# EasyEDA Pro project cyclex.epro

# Schematic Schematic1
Board Name: Board1; Create Date: 2025-05-11
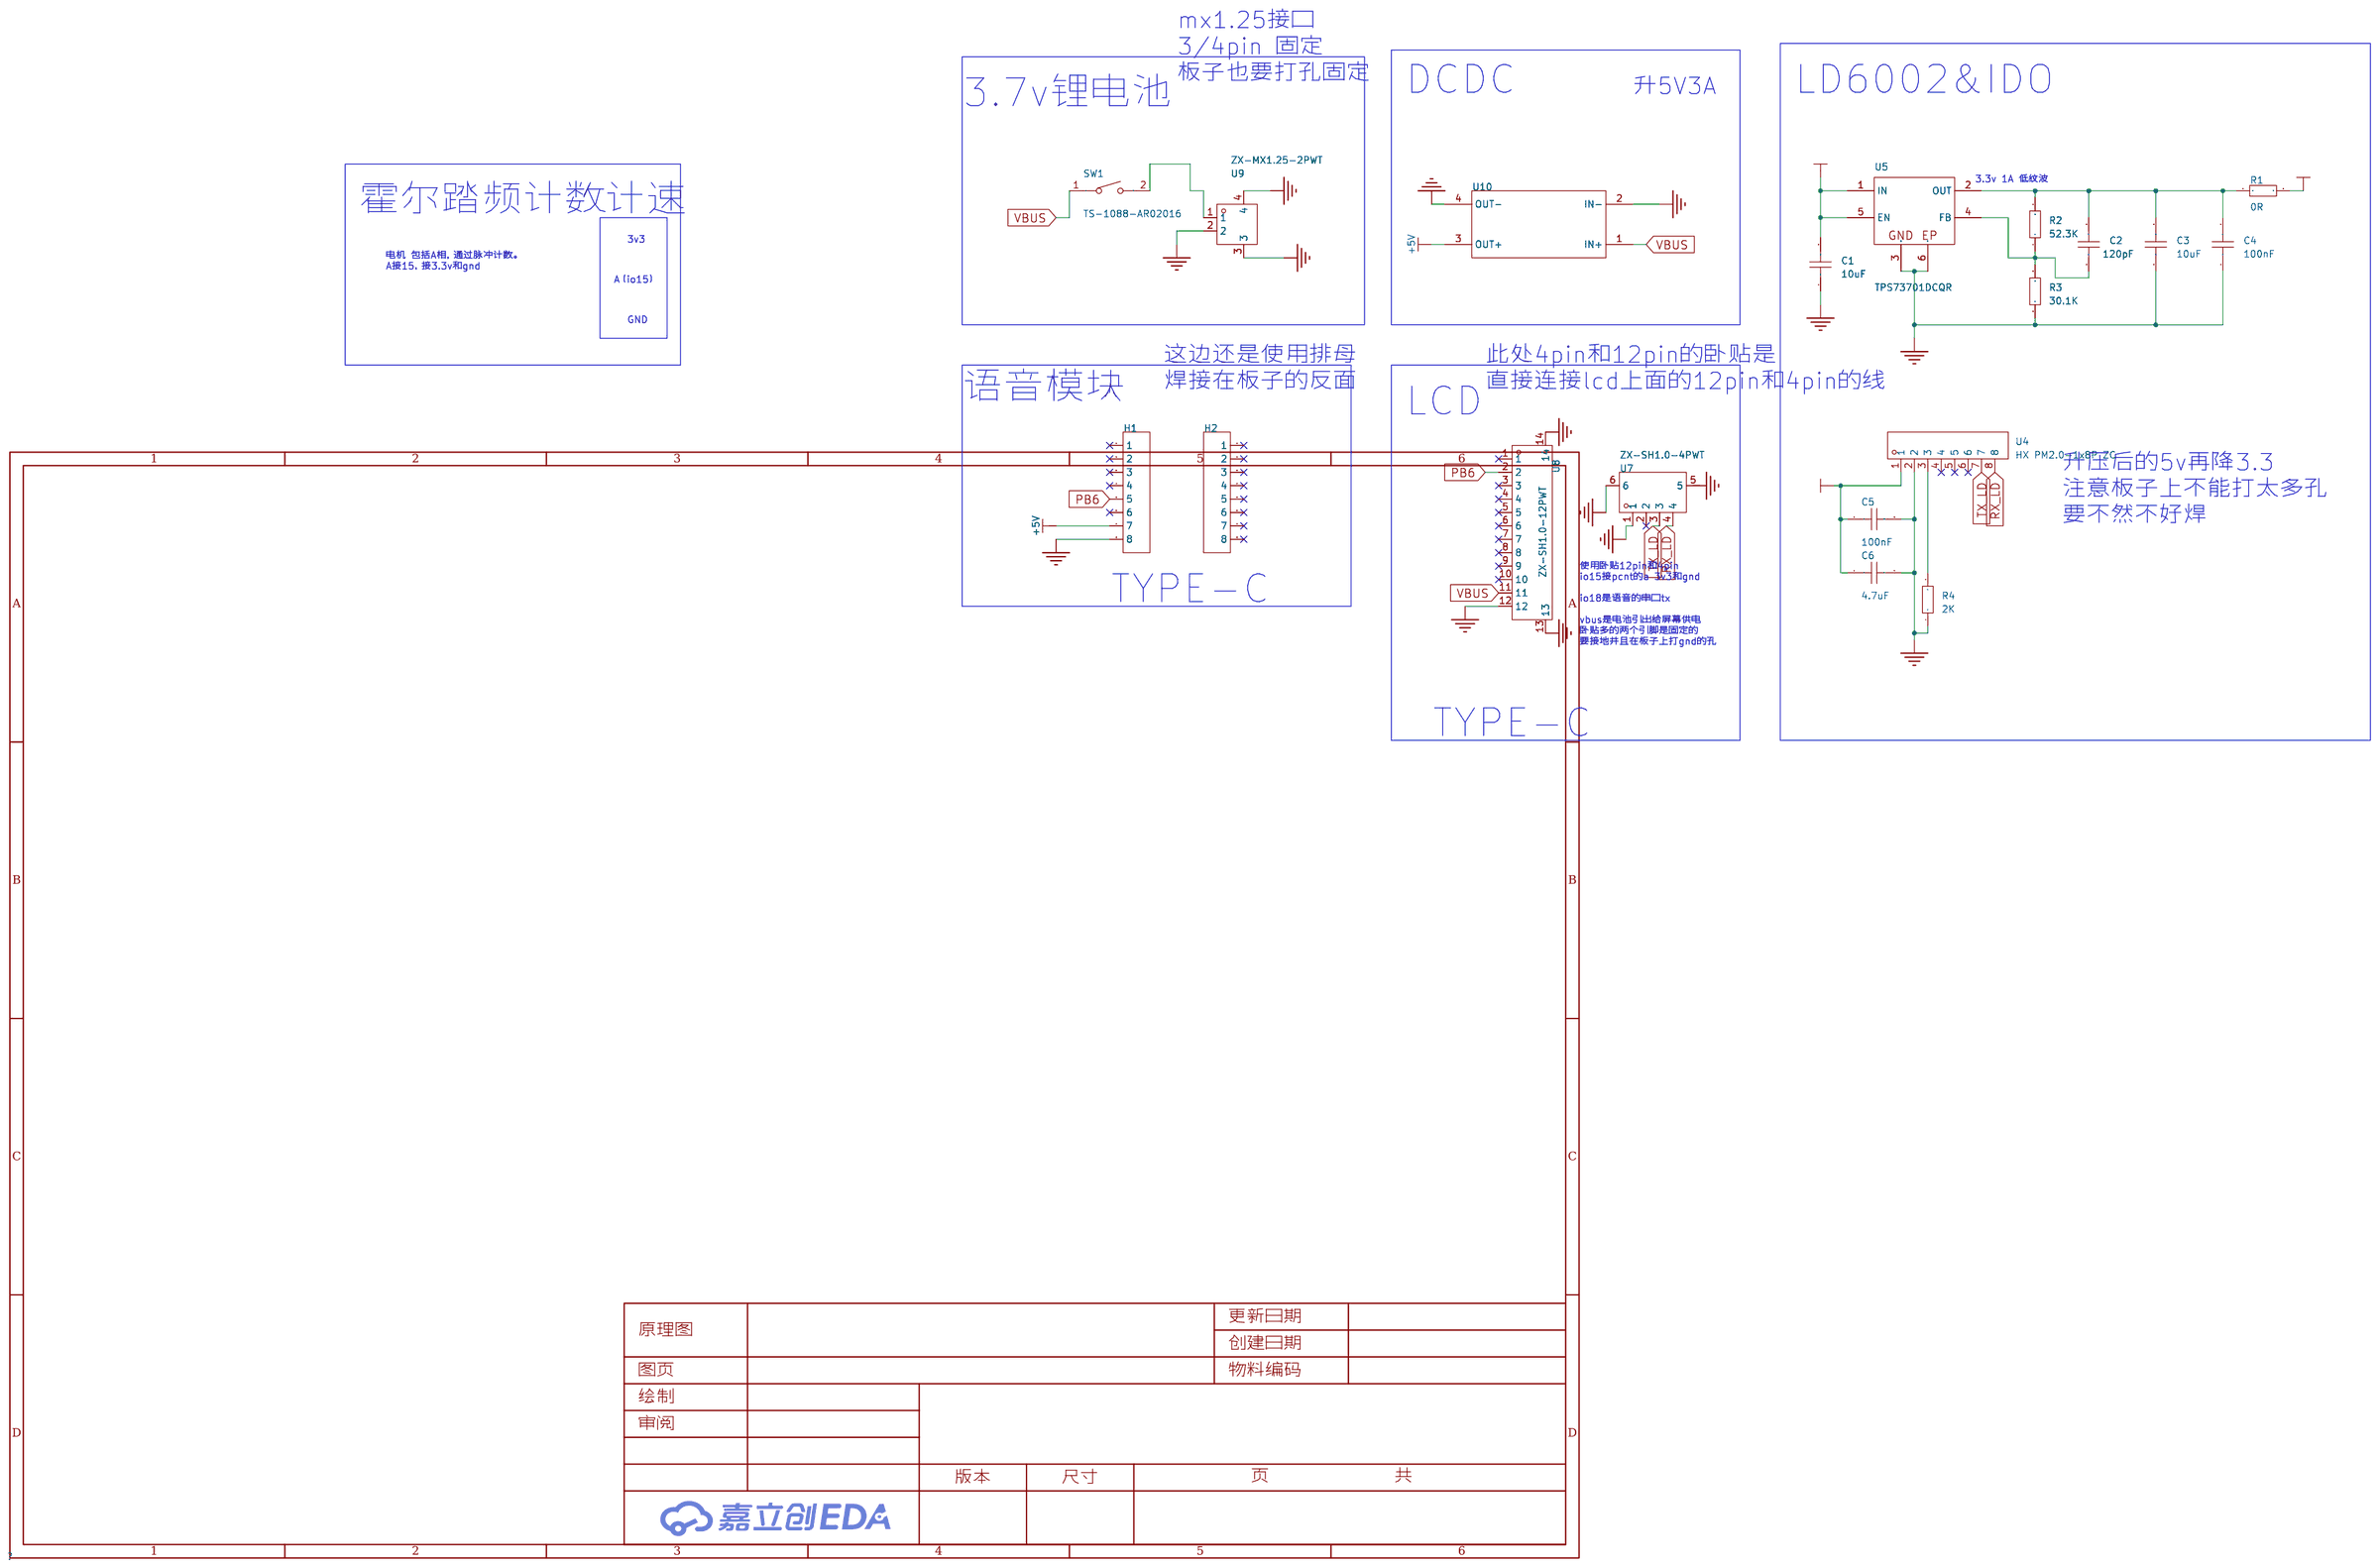
[diagram p0: schematic sheet]

## Parts
C1  10uF  [C0603]
C2  120pF  [C0603]
C3  10uF  [C0805]
C4  100nF  [C0603]
C5  100nF  [C0603]
C6  4.7uF  [C0603]
H1  -  [HDR-TH_8P-P2.54-V-F-1]
H2  -  [HDR-TH_8P-P2.54-V-F-1]
R1  0R  [R0805]
R2  52.3K  [R0603]
R3  30.1K  [R0603]
R4  2K  [R0603]
SW1  TS-1088-AR02016  [SW-SMD_L3.9-W3.0-P4.45]
U4  HX PM2.0-1x8P ZC  [HDR-TH_8P-P2.00-V-F]
U5  TPS73701DCQR  [SOT-223-6_L6.5-W3.5-P1.27-BL]
U7  ZX-SH1.0-4PWT  [CONN-SMD_4P-P1.00_MEGASTAR_ZX-SH1.0-4PWT]
U8  ZX-SH1.0-12PWT  [CONN-SMD_ZX-SH1.0-12PWT]
U9  ZX-MX1.25-2PWT  [CONN-SMD_2P-P1.25_MEGASTAR_ZX-MX1.25-2PWT]
U10  -  [dcdc]

## Library data of the parts
C1 C2 C4-C6 = CAP_0603: Supplier Footprint: 0603
C3 = CAP_0805: Supplier Footprint: 0805
H1 H2 = HDR-F_2.54_1x8P: Supplier Part: C27438; Supplier Footprint: 插件
R1 = Res_0805: Supplier Footprint: 0805
R2-R4 = Res_0603: Supplier Footprint: 0603
SW1 = TS-1088-AR02016: 电路结构:单刀单掷;按钮形状:圆形按钮;作用力:160gf;安装方式:立贴;开关长度:4mm;开关宽度:3mm;开关高度:2mm;带支架:不带;触点电流:50mA;额定电压(DC):12V;绝缘电阻:100MΩ;机械寿命:10万次;; LCSC Part Name: 4*3*2mm 立贴 轻触开关; Supplier Part: C720477; Manufacturer: XUNPU(讯普); Supplier Footprint: SMD; JLCPCB Part Class: 扩展库; Datasheet: https://atta.szlcsc.com/upload/public/pdf/source/20200810/C720475_60D09DD6C54279ADDB2DC25100F1CC11.pdf; Supplier: LCSC; Circuit: 单刀单掷; Actuator Style: 圆形按钮; Operating Force: 160gf; Mounting Style: 立贴; Switch Length: 4mm; Switch Width: 3mm; Switch Height: 2mm; Strike Gundam: 不带; Contact Current: 50mA; Voltage Rating (DC): 12V; Insulation Resistance: 100MΩ; Actuator/Cap Color: 黑色; Pin Style: SMD接片; Mechanical Life: 10万次; Operating Temperature: -30℃~+80℃
U4 = HX PM2.0-1x8P ZC: 插孔结构:1x8P;间距:2mm;行距:-;圆孔/方孔:方孔;安装类型:直插;排数:单排;总孔位数:8P;额定电流:1.5A;额定电压:-;插孔方向:顶部;塑高:4.3mm;触头材质:磷青铜;触头镀层:金;工作温度范围:-40℃~+105℃;; LCSC Part Name: 1x8P 间距:2mm 直插; Supplier Part: C22438140; Manufacturer: hanxia(韩下); Supplier Footprint: 插件,P=2mm; JLCPCB Part Class: 扩展库; Datasheet: https://atta.szlcsc.com/upload/public/pdf/source/20240522/B5FA3F0B86C178839DC93CD9D84878F3.pdf; Supplier: LCSC; Holes Structure: 1x8P; Pitch: 2mm; Circular Hole / Square Hole: 方孔; Mounting Type: 直插; Number of Rows: 单排; Number of Holes: 8P; Current Rating (Max): 1.5A; Holes Direction: 顶部; Insulation Height: 4.3mm; Contact Material: 磷青铜; Contact Plating: 金; Operating Temperature Range: -40℃~+105℃; PIN Length: 2.8mm
U5 = TPS73701DCQR: 输出类型:可调;最大输入电压:5.5V;输出电压:1.2V~5.5V;输出电流:1A;电源纹波抑制比(PSRR):58dB@(100Hz)；37dB@(10kHz);输出极性:正极;; LCSC Part Name: 具有反向电流保护和使能功能的 1A 超低压降稳压器; Supplier Part: C56848; Manufacturer: TI(德州仪器); Supplier Footprint: SOT-223-6; JLCPCB Part Class: 扩展库; Datasheet: https://www.ti.com/cn/lit/gpn/tps737; Supplier: LCSC; Output Type: 可调; Maximum Input Voltage: 5.5V; Output Voltage: 1.2V~5.5V; Output Current: 1A; Power Supply Rejection Ratio (PSRR): 58dB@(100Hz)；37dB@(10kHz); Dropout Voltage: 500mV@(1A); standby current: 400uA; Feature: 防静电保护；过压保护(OVP)；热保护(TSD)；过流保护(OCP)；带使能；带电荷泵；防倒灌; Operating Temperature: -40℃~+125℃; Output Polarity: 正极; Number of Outputs: 1
U7 = ZX-SH1.0-4PWT: 插针结构:1x4P;间距:1mm;安装方式:卧贴;参考系列:SH;总PIN数:4P;排数:1;每排PIN数:4;行距:-;额定电流:-;触头材质:黄铜;触头镀层:锡;工作温度范围:-;; LCSC Part Name: 1x4P 间距:1mm 卧贴 系列:SH; Supplier Part: C7430446; Manufacturer: Megastar(兆星); Supplier Footprint: SMD,P=1mm,卧贴; JLCPCB Part Class: 扩展库; Datasheet: https://atta.szlcsc.com/upload/public/pdf/source/20230619/390816C24B7A0EB1D042395C380CEA99.pdf; Supplier: LCSC; Pins Structure: 1x4P; Pitch: 1mm; Mounting Style: 卧贴; Reference Series: SH; Number of Pins: 4P; Number of Rows: 1; Number of PINs Per Row: 4; Contact Material: 黄铜; Contact Plating: 锡; Supplementary Features: 辅助焊脚; Colour: 米色; Z-Height of the Board: 3.15mm; X-Length of Bottom Edge on Board (Spacing Line): 6.35mm; Y-Width of Bottom Edge on Board: 5.05mm
U8 = ZX-SH1.0-12PWT: 插针结构:1x12P;间距:1mm;安装方式:卧贴;参考系列:SH;总PIN数:12P;排数:1;每排PIN数:12;行距:-;额定电流:-;触头材质:黄铜;触头镀层:锡;工作温度范围:-;; LCSC Part Name: 1x12P 间距:1mm 卧贴 系列:SH; Supplier Part: C22366249; Manufacturer: Megastar(兆星); Supplier Footprint: SMD,P=1mm,卧贴; JLCPCB Part Class: 扩展库; Datasheet: https://atta.szlcsc.com/upload/public/pdf/source/20240326/10FD453CFB7A9AFCA8B3607CE25151C0.pdf; Supplier: LCSC; Pins Structure: 1x12P; Pitch: 1mm; Mounting Style: 卧贴; Reference Series: SH; Number of Pins: 12P; Number of Rows: 1; Number of PINs Per Row: 12; Contact Material: 黄铜; Contact Plating: 锡; Supplementary Features: 辅助焊脚; Colour: 米色; Z-Height of the Board: 3.15mm; X-Length of Bottom Edge on Board (Spacing Line): 14.35mm; Y-Width of Bottom Edge on Board: 5.05mm
U9 = ZX-MX1.25-2PWT: 插针结构:1x2P;间距:1.25mm;安装方式:卧贴;参考系列:PicoBlade(MX 1.25);总PIN数:2P;排数:1;每排PIN数:2;行距:-;额定电流:-;触头材质:黄铜;触头镀层:锡;工作温度范围:-;; LCSC Part Name: 1x2P 间距:1.25mm 卧贴 系列:PicoBlade(MX 1.25) 配套胶壳型号：ZX-MX1.25-2PJK 配套端子型号：ZX-MX1.25-DZ 配套杜邦线型号：ZX-MX1.25-2PBXC; Supplier Part: C7430468; Manufacturer: Megastar(兆星); Supplier Footprint: SMD,P=1.25mm,卧贴; JLCPCB Part Class: 扩展库; Datasheet: https://atta.szlcsc.com/upload/public/pdf/source/20230619/2BD294665F872DB10EDB44FDEDF5F6D3.pdf; Supplier: LCSC; Pins Structure: 1x2P; Pitch: 1.25mm; Mounting Style: 卧贴; Reference Series: PicoBlade(MX 1.25); Number of Pins: 2P; Number of Rows: 1; Number of PINs Per Row: 2; Contact Material: 黄铜; Contact Plating: 锡; Supplementary Features: 辅助焊脚; Colour: 米色; Z-Height of the Board: 3.6mm; X-Length of Bottom Edge on Board (Spacing Line): 7.5mm; Y-Width of Bottom Edge on Board: 5.25mm
U10 = dcdc

## Nets
3V3LD: C5.1 C6.1 R1.2 U4.1
+5V: C1.2 H1.7 U5.1(IN) U5.5(EN) U10.3(OUT+)
GND: C1.1 C3.1 C4.1 C5.2 C6.2 H1.8 R3.1 R4.1 U4.2 U5.3(GND) U5.6(EP) U7.1 U7.5 U7.6 U8.12 U8.13 U8.14 U9.2 U9.3 U9.4 U10.2(IN-) U10.4(OUT-)
VBUS: SW1.1 U8.11 U10.1(IN+)
PB6: H1.5 U8.2
RX_LD: U4.8 U7.4
TX_LD: U4.7 U7.3
$1N1757: C2.2 C3.2 C4.2 R1.1 R2.2 U5.2(OUT)
$1N1758: C2.1 R2.1 R3.2 U5.4(FB)
$1N1762: R4.2 U4.3
$1N4709: SW1.2 U9.1

Not connected (* = marked no-connect by the designer): H1 1* 2* 3* 4* 6*; H2 1* 2* 3* 4* 5* 6* 7* 8*; U4 4* 5* 6*; U7 2*; U8 1* 3* 4* 5* 6* 7* 8* 9* 10*

## Notes on the sheet
- mx1.25接口
  3/4pin 固定
  板子也要打孔固定
- 3.7v锂电池
- DCDC
- 升5V3A
- LD6002&IDO
- 3.3v 1A 低纹波
- 霍尔踏频计数计速
- 3v3
- 电机 包括A相，通过脉冲计数。
  A接15，接3.3v和gnd
- A（io15）
- GND
- 这边还是使用排母
  焊接在板子的反面
- 此处4pin和12pin的卧贴是
  直接连接lcd上面的12pin和4pin的线
- 语音模块
- LCD
- 升压后的5v再降3.3
  注意板子上不能打太多孔
  要不然不好焊
- TYPE-C
- 使用卧贴12pin和4pin
  io15接pcnt的a 3v3和gnd
  io18是语音的串口tx
  vbus是电池引出给屏幕供电
  卧贴多的两个引脚是固定的
  要接地并且在板子上打gnd的孔
- TYPE-C

# Board PCB1
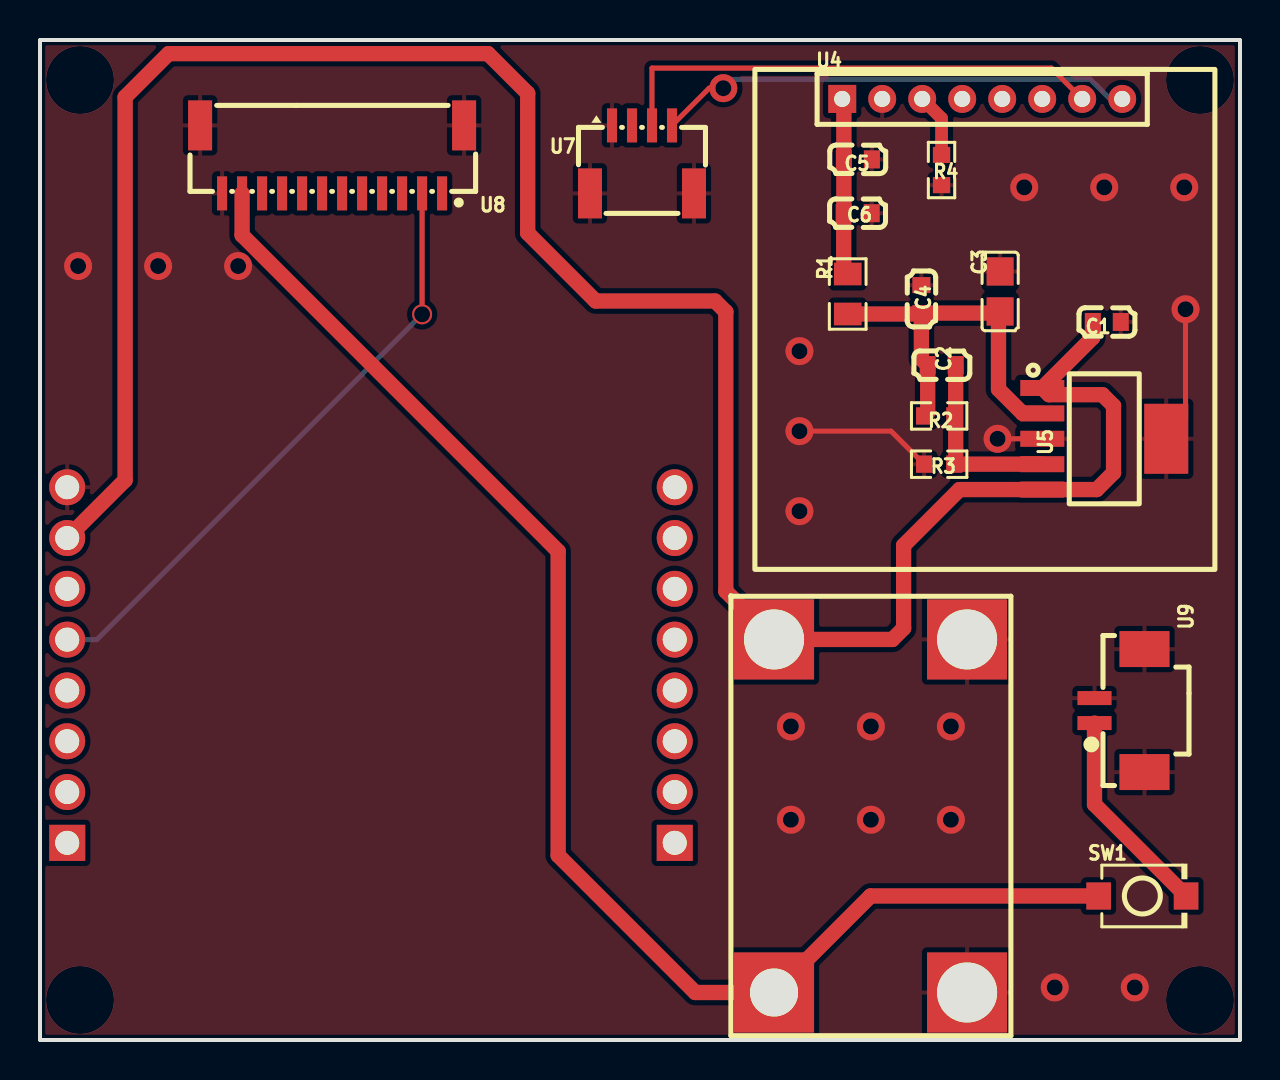
[diagram p1: board, top side]
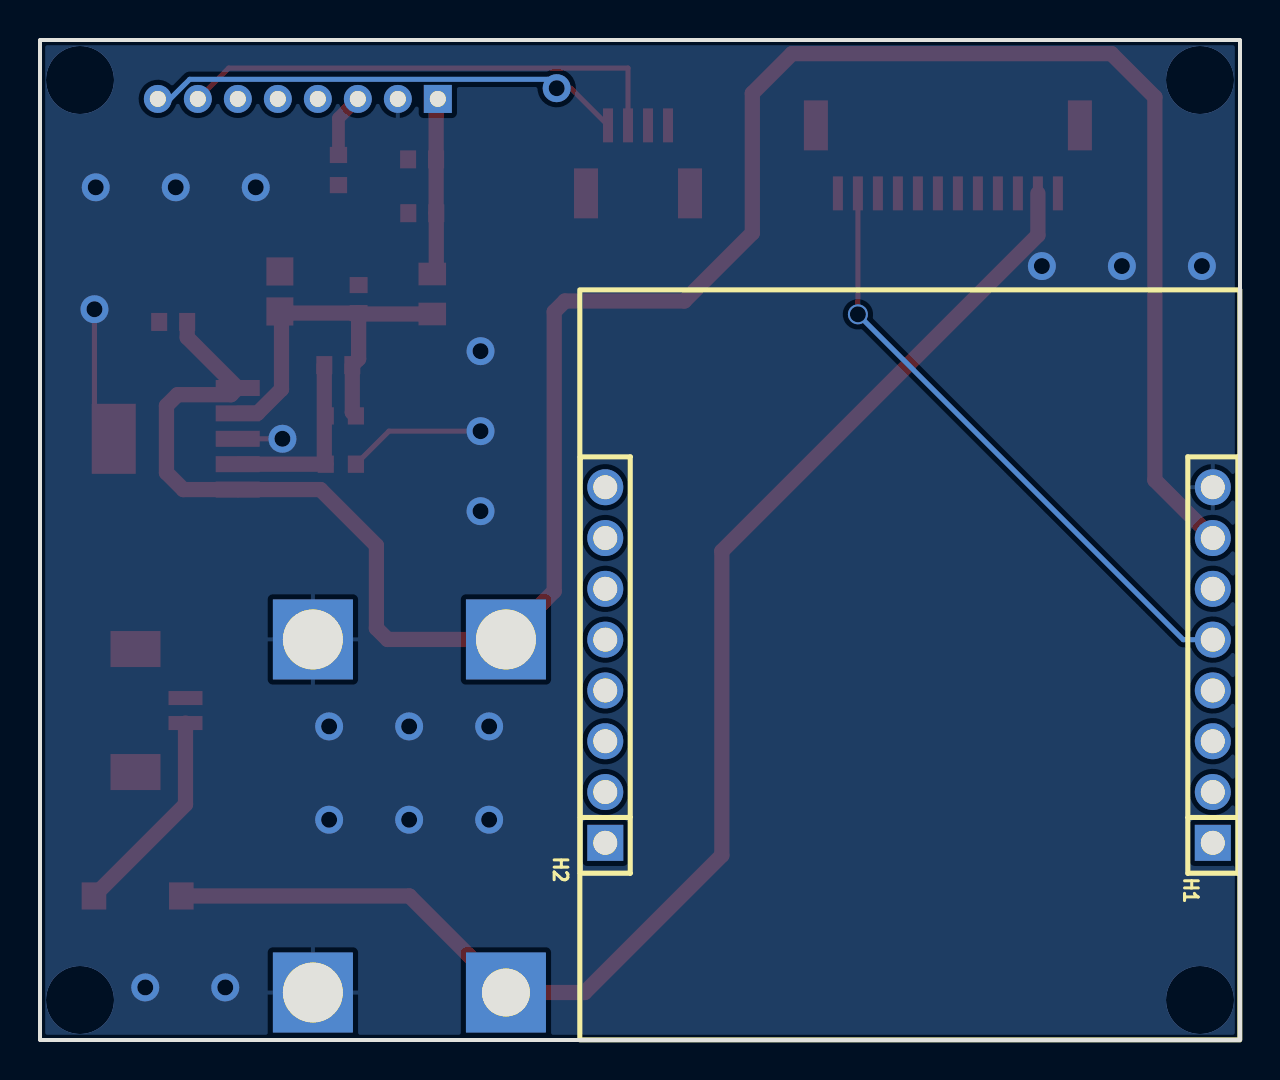
[diagram p2: board, bottom side, seen from below]

Outline 60 x 50 mm; copper layers: Top Layer, Bottom Layer. Coordinates in mm from the lower left corner of the outline.
Outline path: rectangle 0,50 60,0
Stack: Top Layer 0.035mm / Dielectric1 1.51mm FR4 er 4.5 / Bottom Layer 0.035mm

## Design rules (mm)
template: JLCPCB Capability(Two Layers Board)
spacing copperThickness1oz (default): track to track 0.102, other pairs 0.152 to 0.3
spacing copperThickness2oz: track to track 0.203, other pairs 0.152 to 0.3
track width copperThickness1oz (default): min 0.127, default 0.254, max 2.54
track width copperThickness2oz: min 0.203, default 0.254, max 2.54
differential pair differentialPair (default): width min 0.127, default 0.254, max 2.54; gap min 0.152, default 0.152
via viaSize (default): diameter min 0.5, default 0.61, max 10; hole min 0.3, default 0.305, max 6.3

## Placement (name value [footprint] x y rotation side)
C1  10uF  [C0603]  53.34 35.9 180 top
C2  120pF  [C0603]  45.09 33.74 180 top
C3  10uF  [C0805]  48.01 37.43 270 top
C4  100nF  [C0603]  44.07 37.05 270 top
C5  100nF  [C0603]  40.89 44.03 0 top
C6  4.7uF  [C0603]  40.89 41.34 0 top
H1  -  [HDR-TH_8P-P2.54-V-F-1]  1.36 18.75 90 bottom
H2  -  [HDR-TH_8P-P2.54-V-F-1]  31.74 18.75 90 bottom
R1  0R  [R0805]  40.39 37.3 90 top
R2  52.3K  [R0603]  44.96 31.2 180 top
R3  30.1K  [R0603]  44.96 28.79 0 top
R4  2K  [R0603]  45.08 43.5 90 top
SW1  TS-1088-AR02016  [SW-SMD_L3.9-W3.0-P4.45]  55.12 7.2 0 top
U4  HX PM2.0-1x8P ZC  [HDR-TH_8P-P2.00-V-F]  47.11 47.05 0 top
U5  TPS73701DCQR  [SOT-223-6_L6.5-W3.5-P1.27-BL]  53.21 30.06 270 top
U7  ZX-SH1.0-4PWT  [CONN-SMD_4P-P1.00_MEGASTAR_ZX-SH1.0-4PWT]  30.1 44.03 0 top
U8  ZX-SH1.0-12PWT  [CONN-SMD_ZX-SH1.0-12PWT]  14.6 44.03 180 top
U9  ZX-MX1.25-2PWT  [CONN-SMD_2P-P1.25_MEGASTAR_ZX-MX1.25-2PWT]  53.97 16.47 270 top
U10  -  [dcdc]  34.54 0.22 90 top

## Footprints (pads in the part's own frame, mm; a bottom-side part is the same pattern mirrored in y, then rotated)
C0603
  rect 0.8x0.9 smd: 1(-0.7,0) 2(0.7,0)
C0805
  rect 1.41x1.35 smd: 1(-1,0) 2(1,0)
CONN-SMD_2P-P1.25_MEGASTAR_ZX-MX1.25-2PWT
  rect 0.7x1.7 smd: 1(0.625,-1.25) 2(-0.625,-1.25)
  rect 1.8x2.5 smd: 3(-3.075,1.25) 4(3.075,1.25)
CONN-SMD_4P-P1.00_MEGASTAR_ZX-SH1.0-4PWT
  rect 0.5x1.7 smd: 1(-1.5,1.7) 2(-0.5,1.7) 3(0.5,1.7) 4(1.5,1.7)
  rect 1.2x2.5 smd: 5(2.6,-1.7) 6(-2.6,-1.7)
CONN-SMD_ZX-SH1.0-12PWT
  rect 0.5x1.7 smd: 1(-5.5,1.7) 2(-4.5,1.7) 3(-3.5,1.7) 4(-2.5,1.7) 5(-1.5,1.7) 6(-0.5,1.7) 7(0.5,1.7) 8(1.5,1.7) 9(2.5,1.7) 10(3.5,1.7) 11(4.5,1.7) 12(5.5,1.7)
  rect 1.2x2.5 smd: 13(6.6,-1.7) 14(-6.6,-1.7)
dcdc
  rect 4x4 hole 2.4: 1(2.159,-2.159)
  rect 4x4 hole 3: 2(2.159,-11.811) 3(19.812,-2.159) 4(19.812,-11.811)
HDR-TH_8P-P2.00-V-F
  rect 1.4x1.4 hole 0.8: 1(-7,0)
  round 1.4 hole 0.8: 2(-5,0) 3(-3,0) 4(-1,0) 5(1,0) 6(3,0) 7(5,0) 8(7,0)
HDR-TH_8P-P2.54-V-F-1
  rect 1.8x1.8 hole 1.2: 1(-8.89,0)
  round 1.8 hole 1.2: 2(-6.35,0) 3(-3.81,0) 4(-1.27,0) 5(1.27,0) 6(3.81,0) 7(6.35,0) 8(8.89,0)
R0603
  rect 0.806x0.864 smd: 1(-0.753,0) 2(0.753,0)
R0805
  rect 1.133x1.377 smd: 1(-1,0) 2(1,0)
SOT-223-6_L6.5-W3.5-P1.27-BL
  rect 0.8x2.2 smd: 1(-2.54,-3.099) 2(-1.27,-3.099) 3(0,-3.099) 4(1.27,-3.099) 5(2.54,-3.099)
  rect 3.5x2.2 smd: 6(0,3.099)
SW-SMD_L3.9-W3.0-P4.45
  rect 1.23x1.36 smd: 1(-2.185,0) 2(2.185,0)

## Nets
As in the schematic.

Pads without a net: H1 1 2 3 4 6; H2 1 2 3 4 5 6 7 8; U4 4 5 6; U7 2; U8 1 3 4 5 6 7 8 9 10

## Via types
v1: diameter 1.4, hole 0.8, Top Layer to Bottom Layer, 20 vias
v2: diameter 3.4, hole 3.4, Top Layer to Bottom Layer, 4 vias
v3: diameter 1, hole 0.8, Top Layer to Bottom Layer, 1 via

## Routing (per net, layer and track width the routed paths; a pad name or vN(x,y) marks a point on that pad's centre or on a via; arc(x,y) is an arc through that point)
3V3LD: length 8.9
  Top Layer w0.762: U4.1 40.19,46.97 C5.1 40.19,41.35 C6.1 40.19,38.5 R1.2
+5V: length 115.5
  Top Layer w0.762: H1.7 4.26,27.99 4.26,47.14 6.43,49.32 22.4,49.32 24.38,47.33 24.38,40.35 27.78,36.95 33.75,36.95 34.29,36.41 34.29,22.44 U10.3 42.62,20.03 43.18,20.59 43.18,24.73 45.97,27.52 U5.5 52.83,27.52 53.68,28.37 53.68,31.71 53.12,32.26 50.45,32.26 50.11,32.6 52.64,35.13 C1.2
GND: length 16
  Top Layer w0.254: U5.6 57.28,31.03 v1(57.28,36.54) ; U5.3 v1(47.88,30.06) ; R3.1 42.55,30.44 v1(37.97,30.44)
  vias: v1(1.91,38.7) v1(5.91,38.7) v1(9.91,38.7) v1(37.54,15.68) v1(37.54,11.01) v1(37.97,34.44) v1(37.97,26.44) v1(41.54,15.68) v1(41.54,11.01) v1(45.54,15.68) v1(45.54,11.01) v1(49.21,42.63) v1(50.74,2.63) v1(53.21,42.63) v1(54.74,2.63) v1(57.21,42.63) v2(2,48) v2(2,2) v2(58,48) v2(58,2)
VBUS: length 71.5
  Top Layer w0.762: SW1.1 41.53,7.2 U10.1 32.77,2.38 25.91,9.23 25.91,24.44 10.1,40.24 U8.11
PB6: length 30.5
  Top Layer w0.254: U8.2 v3(19.1,36.28)
  Bottom Layer w0.254: v3(19.1,36.28) 2.84,20.02 H1.5
RX_LD: length 23.9
  Top Layer w0.254: U7.4 33.46,47.59 v1(34.17,47.59)
  Bottom Layer w0.254: v1(34.17,47.59) 34.61,48.03 52.51,48.03 53.49,47.05 U4.8
TX_LD: length 25
  Top Layer w0.254: U7.3 30.6,48.59 50.57,48.59 U4.7
$1N1757: length 19.5
  Top Layer w0.762: U5.2 49.13,31.33 47.93,32.54 47.93,36.35 ; R2.2 44.38,31.38 44.38,33.74 44.07,34.06 C4.2 ; R1.1 44.02,36.3 C4.2 ; 47.93,36.35 C3.2 ; 47.93,36.35 C4.2
$1N1758: length 9.4
  Top Layer w0.762: C2.1 45.78,28.86 R3.2 U5.4
$1N1762: length 3.1
  Top Layer w0.635: U4.3 45.08,46.09 45.08,44.38
$1N4709: length 10.5
  Top Layer w0.762: SW1.2 52.72,11.78 U9.1

## Copper pours and planes (outline as drawn; the poured copper is in the pictures)
GND on Top Layer: -6.1,52.67 65.66,52.67 65.66,-4.61 -6.1,-4.61
GND on Bottom Layer: -6.1,53.68 66.29,53.68 66.29,-8.29 -6.1,-8.29

## Text on the board
Top Silkscreen Layer: 注意卧贴以及3.7v升级5v | 注意电池的卧贴 还有12pin和4pin | 语音在背面
